# Altium schematic sheet nguon.SchDoc
size 381 x 241 mm; SheetNumber: 1; SheetTotal: 5
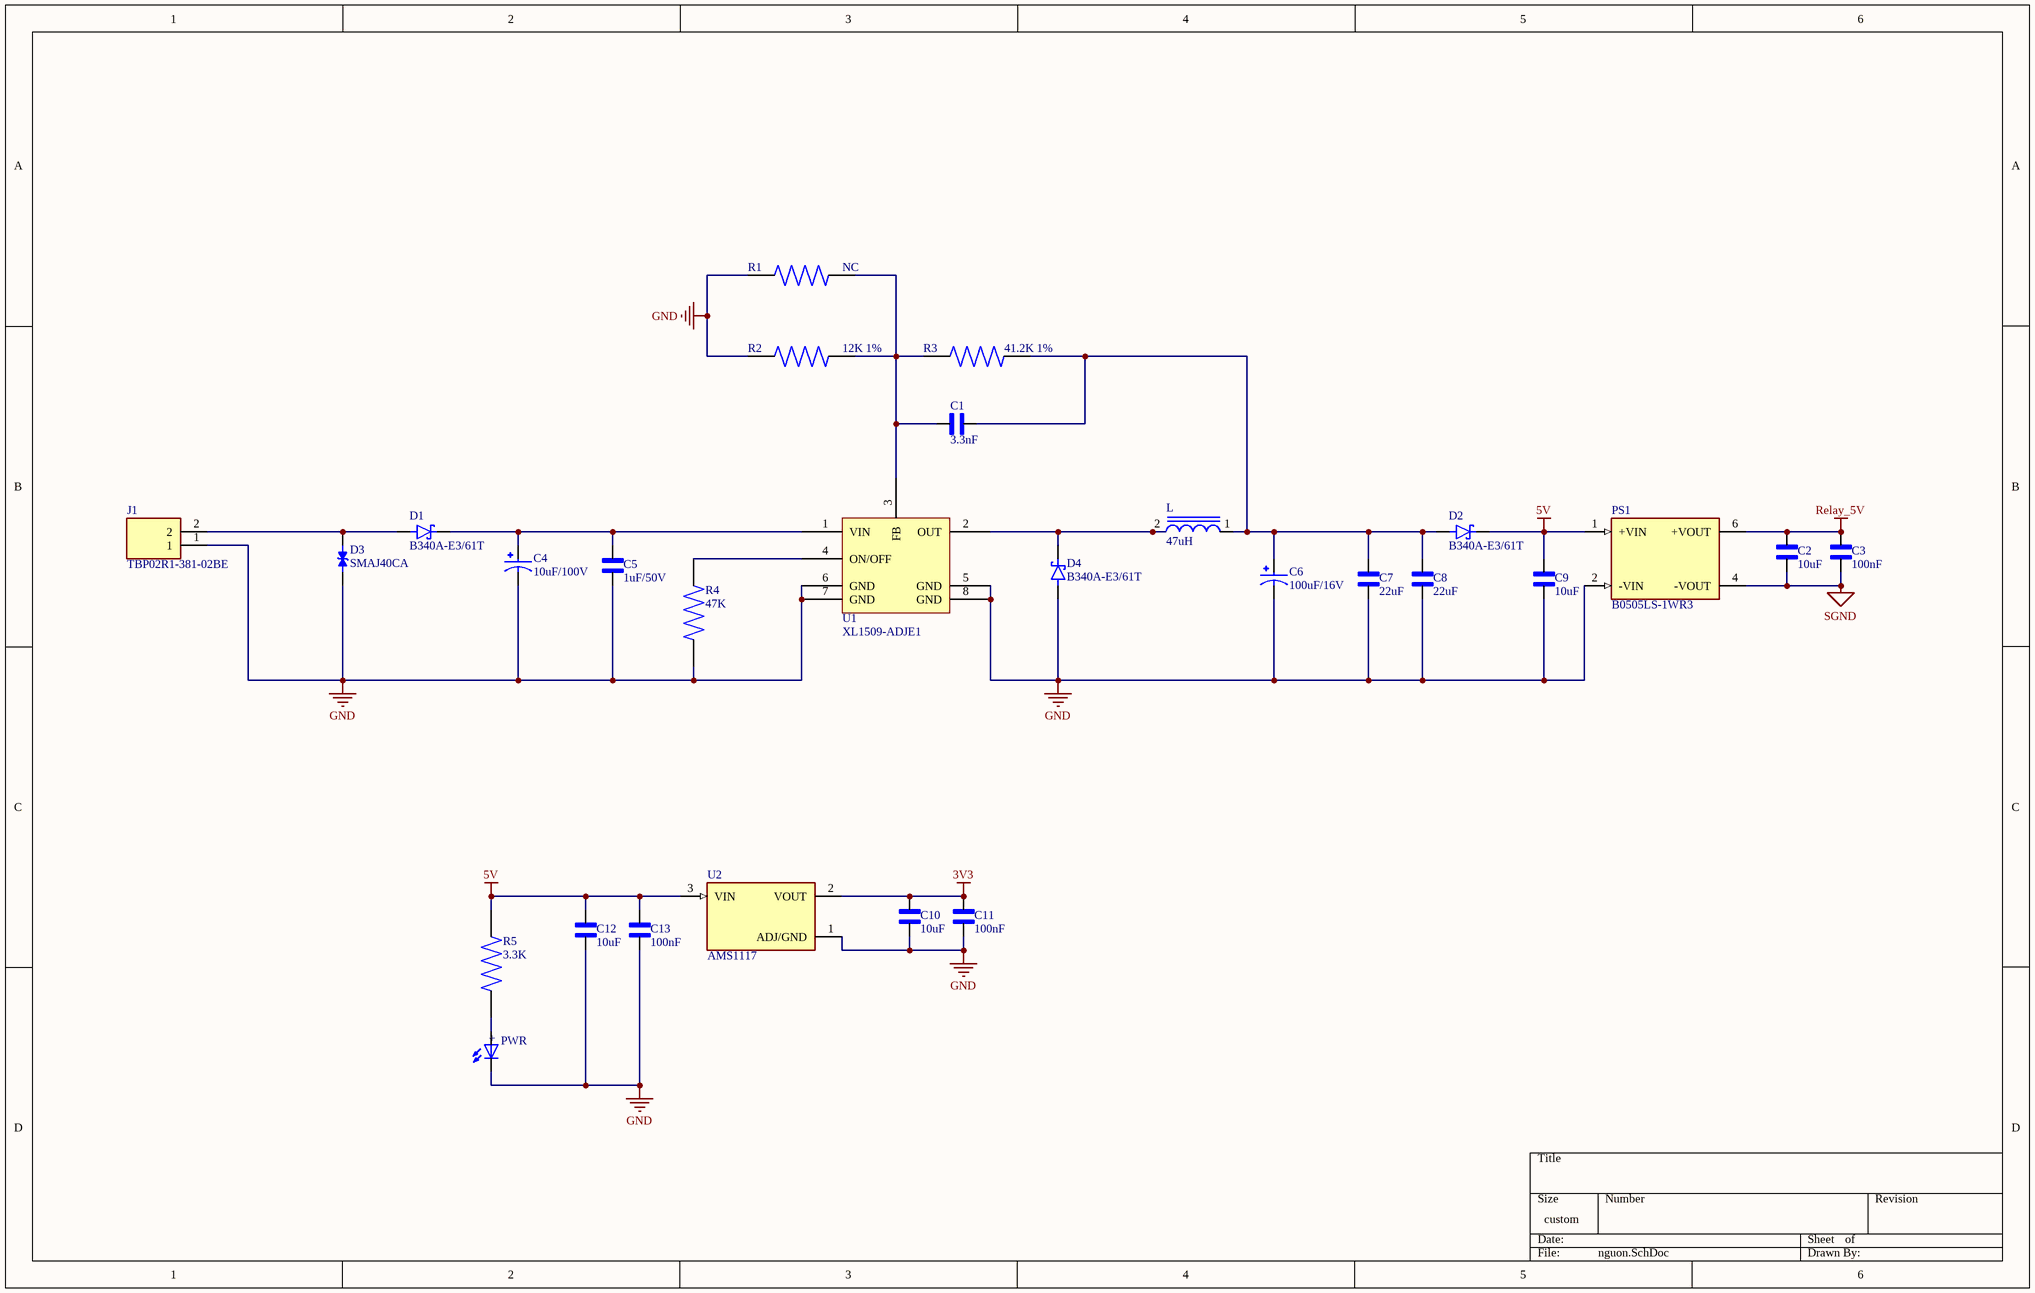
[diagram p0: nguon.SchDoc]

## Parts
C1  3.3nF  [CAPC1608X94N]
C2  10uF  [CAPC1608X94N]
C3  100nF  [CAPC1608X94N]
C4  10uF/100V  [CAP_EEEFN2A100P]
C5  1uF/50V  [CAPC1608X94N]
C6  100uF/16V  [CAP_EEETC1C101XV]
C7  22uF  [CAPC1608X94N]
C8  22uF  [CAPC1608X94N]
C9  10uF  [CAPC1608X94N]
C10  10uF  [CAPC1608X94N]
C11  100nF  [CAPC1608X94N]
C12  10uF  [CAPC1608X94N]
C13  100nF  [CAPC1608X94N]
D1  B340A-E3/61T  [DIOM5126X229N]
D2  B340A-E3/61T  [DIOM5126X229N]
D3  SMAJ40CA  [DIOM4325X250N]
D4  B340A-E3/61T  [DIOM5126X229N]
J1  TBP02R1-381-02BE  [CUI_TBP02R1-381-02BE]
L  47uH  [Introdutor_47uH_12x12x7]
PS1  B0505LS-1WR3  [CONV_RFB-0505S]
PWR  WL-SMCW_1206  [WL-SMCW_1206]  (value not drawn)
R1  NC  [RES_ERJU03J474V]
R2  12K 1%  [RES_ERJU03J474V]
R3  41.2K 1%  [RES_ERJU03J474V]
R4  47K  [RES_ERJU03J474V]
R5  3.3K  [RES_ERJU03J474V]
U1  XL1509-ADJE1  [SOIC127P599X175-8N]
U2  AMS1117  [SOT229P700X180-4N]

## Nets
3V3: C10.2 C11.2 U2.2(VOUT)
5V: C9.2 C12.2 C13.2 D2.C PS1.1(+VIN) R5.2 U2.3(VIN)
GND: C4.2 C5.1 C6.2 C7.1 C8.1 C9.1 C10.1 C11.1 C12.1 C13.1 D3.1 D4.A J1.1 PS1.2(-VIN) PWR.1(NEG) R1.2 R2.2 R4.1 U1.5(GND) U1.6(GND) U1.7(GND) U1.8(GND) U2.1(ADJ/GND)
Relay_5V: C2.2 C3.2 PS1.6(+VOUT)
SGND: C2.1 C3.1 PS1.4(-VOUT)
NetC1_1: C1.1 C6.1 C7.2 C8.2 D2.A L.1 R3.1
NetC1_2: C1.2 R1.1 R2.1 R3.2 U1.3(FB)
NetC4_1: C4.1 C5.2 D1.C U1.1(VIN)
NetD1_A: D1.A D3.2 J1.2
NetD4_C: D4.C L.2 U1.2(OUT)
NetPWR_2: PWR.2(POS) R5.1
NetR4_2: R4.2 U1.4(ON/OFF)

## Notes on the sheet
- (in symbol WL-SMCW_1206) +

## Library data of the parts
C1-C3 C5 C7-C13 = cap_0603_VJ0603D3R9DXCAP: cap 0603 (1608 Metric); MF: Vishay Vitramon; SnapEDA_Link: https://www.snapeda.com/parts/VJ0603D3R9DXCAP/Vishay/view-part/?ref=snap; Package: 1608 Vishay Vitramon; Value: *; MP: VJ0603D3R9DXCAP; Check_prices: https://www.snapeda.com/parts/VJ0603D3R9DXCAP/Vishay/view-part/?ref=eda
C4 = EEEFN2A100P: CAP ALUM 10UF 20% 100V SMD; MF: Panasonic; SnapEDA_Link: https://www.snapeda.com/parts/EEEFN2A100P/Panasonic/view-part/?ref=snap; Package: RADIAL-2 Panasonic; Value: *; MP: EEEFN2A100P; Check_prices: https://www.snapeda.com/parts/EEEFN2A100P/Panasonic/view-part/?ref=eda
C6 = EEETC1C101XV: CAP ALUM 100UF 20% 16V SMD; MF: Panasonic; Package: RADIAL-2 Panasonic; Price: None; Check_prices: https://www.snapeda.com/parts/EEETC1C101XV/Panasonic/view-part/?ref=eda; Value: *; SnapEDA_Link: https://www.snapeda.com/parts/EEETC1C101XV/Panasonic/view-part/?ref=snap; MP: EEETC1C101XV; Availability: In Stock; Purchase-URL: https://pricing.snapeda.com/search/part/EEETC1C101XV/?ref=eda
D1 D2 D4 = B340A-E3/61T: Diode Schottky 40 V 3A Surface Mount DO-214AC (SMA); MF: Vishay Semiconductor; SnapEDA_Link: https://www.snapeda.com/parts/B340A-E3/61T/Vishay/view-part/?ref=snap; Package: DO-214 Vishay Semiconductor; Value: *; MP: B340A-E3/61T; Check_prices: https://www.snapeda.com/parts/B340A-E3/61T/Vishay/view-part/?ref=eda
D3 = SMAJ40CA: Transient Voltage Suppressor, TVS, Transil SMAJ Series, Bidirectional, 40 V, DO-214AC, 2, 44.4 V; MF: STMicroelectronics; MP: SMAJ40CA-TR; SnapEDA_Link: https://www.snapeda.com/parts/SMAJ40CA-TR/STMicroelectronics/view-part/?ref=snap; Package: DO-214 STMicroelectronics; Value: *; Check_prices: https://www.snapeda.com/parts/SMAJ40CA-TR/STMicroelectronics/view-part/?ref=eda
J1 = TBP02R1-381-02BE: 2~24 Poles, Pluggable,Receptacle, Horizontal, 3.81 Pitch, Terminal Block Connector; MF: Same Sky; SnapEDA_Link: https://www.snapeda.com/parts/TBP02R1-381-02BE/Same+Sky/view-part/?ref=snap; Package: None; Value: *; MP: TBP02R1-381-02BE; Check_prices: https://www.snapeda.com/parts/TBP02R1-381-02BE/Same+Sky/view-part/?ref=eda
L = Introdutor_47uH_12x12x7SRR1260-470M: 47ÂµH Shielded Wirewound Inductor 2.6A 86mOhm Max Nonstandard; MF: Bourns; Value: *; Package: Nonstandard Bourns; Price: None; SnapEDA_Link: https://www.snapeda.com/parts/SRR1260-470M/Bourns/view-part/283129/?ref=snap; Availability: Unavailable; MP: SRR1260-470M
PS1 = B0505LS-1WR3: 1W DC/DC-Converter 'ECONOLINE' SIP7 1kV unreg; MF: Recom Power; MP: RFB-0505S; SnapEDA_Link: https://www.snapeda.com/parts/RFB-0505S/Recom+Power/view-part/?ref=snap; Package: SIP-6 Recom Power; Value: *; Check_prices: https://www.snapeda.com/parts/RFB-0505S/Recom+Power/view-part/?ref=eda
PWR = WL-SMCW_1206: 1206, Blue Typ.(@20mA): 470nm, 145mcd, 3.2V, 140Â° InGaN; MF: Wurth Electronics; MP: 150120BS75000; SnapEDA_Link: https://www.snapeda.com/parts/150120BS75000/Wurth+Electronics/view-part/?ref=snap; Package: 1206 Wurth Electronics; Value: *; Check_prices: https://www.snapeda.com/parts/150120BS75000/Wurth+Electronics/view-part/?ref=eda
R1-R5 = res_0603_ERJU03J474V: 0603 Anti-Sulfurated; MF: Panasonic; SnapEDA_Link: https://www.snapeda.com/parts/ERJU03J474V/Panasonic/view-part/?ref=snap; Package: 1608-2 Panasonic; Value: *; MP: ERJU03J474V; Check_prices: https://www.snapeda.com/parts/ERJU03J474V/Panasonic/view-part/?ref=eda
U1 = XL1509-ADJE1: 2A 150KHz 40V Buck DC to DC Converter; MF: Texas Instruments; MP: LM358DR; SnapEDA_Link: https://www.snapeda.com/parts/LM358DR/Texas+Instruments/view-part/?ref=snap; Package: SOIC-8 Texas Instruments; Value: *; Check_prices: https://www.snapeda.com/parts/LM358DR/Texas+Instruments/view-part/?ref=eda
U2 = AMS1117: 1A LOW DROPOUT VOLTAGE REGULATOR SOT-223; MF: Advanced Monolithic Systems; SnapEDA_Link: https://www.snapeda.com/parts/AMS1117/Advanced+Monolithic+Systems/view-part/?ref=snap; Package: SOT-223 Seeed Technology; Value: *; MP: AMS1117; Check_prices: https://www.snapeda.com/parts/AMS1117/Advanced+Monolithic+Systems/view-part/?ref=eda